# EasyEDA Pro project ProPrj_micropaD_2025-05-19.epro

# Schematic Schematic1
Board Name: Board1; Create Date: 2025-05-16; Page Name: P1; Project Name: micropaD; Schematic Name: Schematic1; Update Date: 2025-05-16; Company: EasyEDA.com; Page Size: A4; Version: V1.0
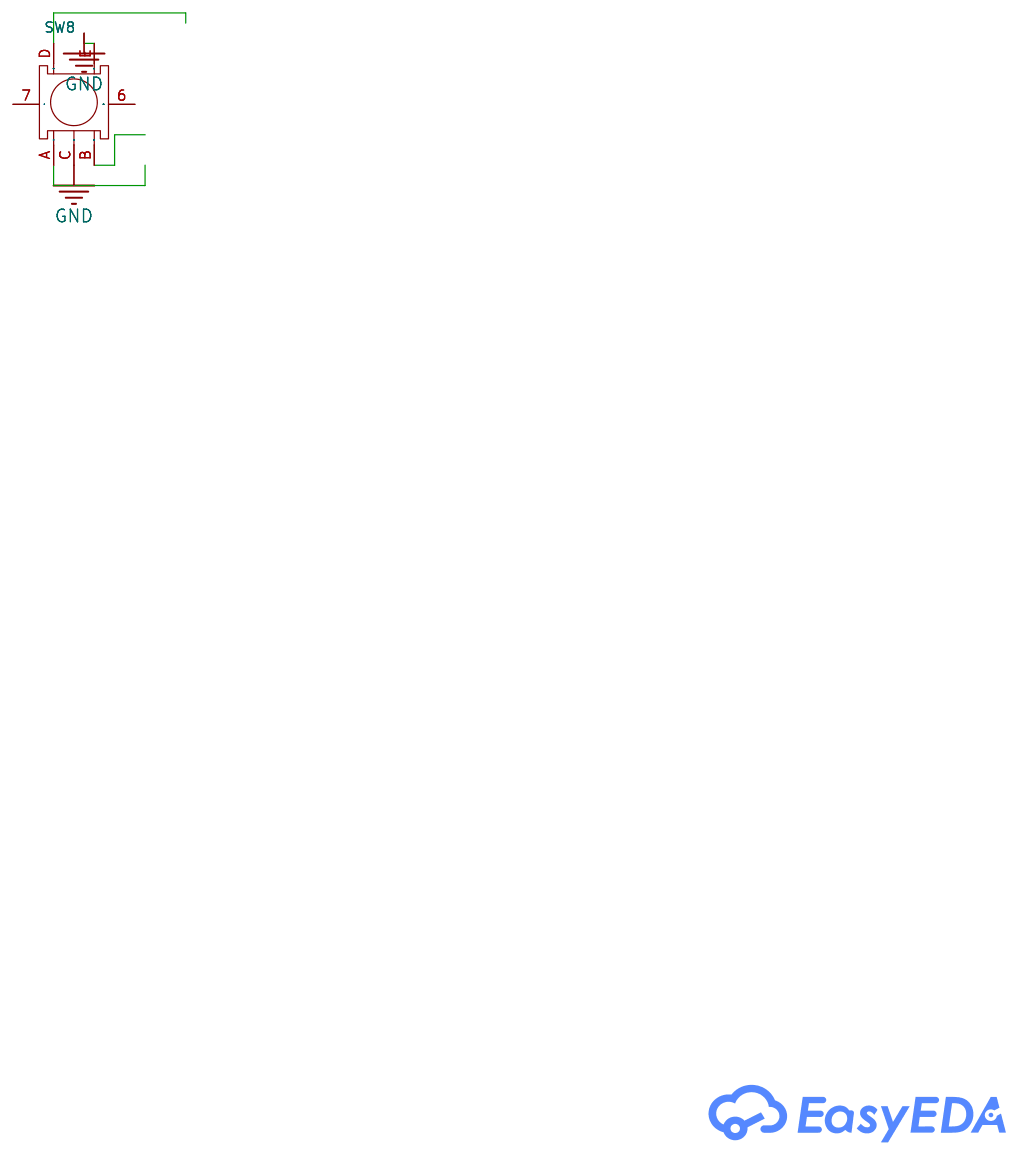
[diagram p0: schematic sheet]

## Parts
SW8  EC11E15244B2  [SW-TH_EC11XXXXXXXX]

## Library data of the parts
SW8 = EC11E15244B2_C470754: Supplier Part: C470754; Manufacturer: ALPSALPINE(阿尔卑斯阿尔派); Supplier Footprint: 插件; JLCPCB Part Class: Extended Part; Datasheet: https://atta.szlcsc.com/upload/public/pdf/source/20191216/C470795_DE763ECE59BD49533DB26DB53E5D34B2.pdf; Supplier: LCSC

## Nets
GND: SW8.C SW8.E

Not connected (* = marked no-connect by the designer): SW8 6 7 A B D

# Board PCB1
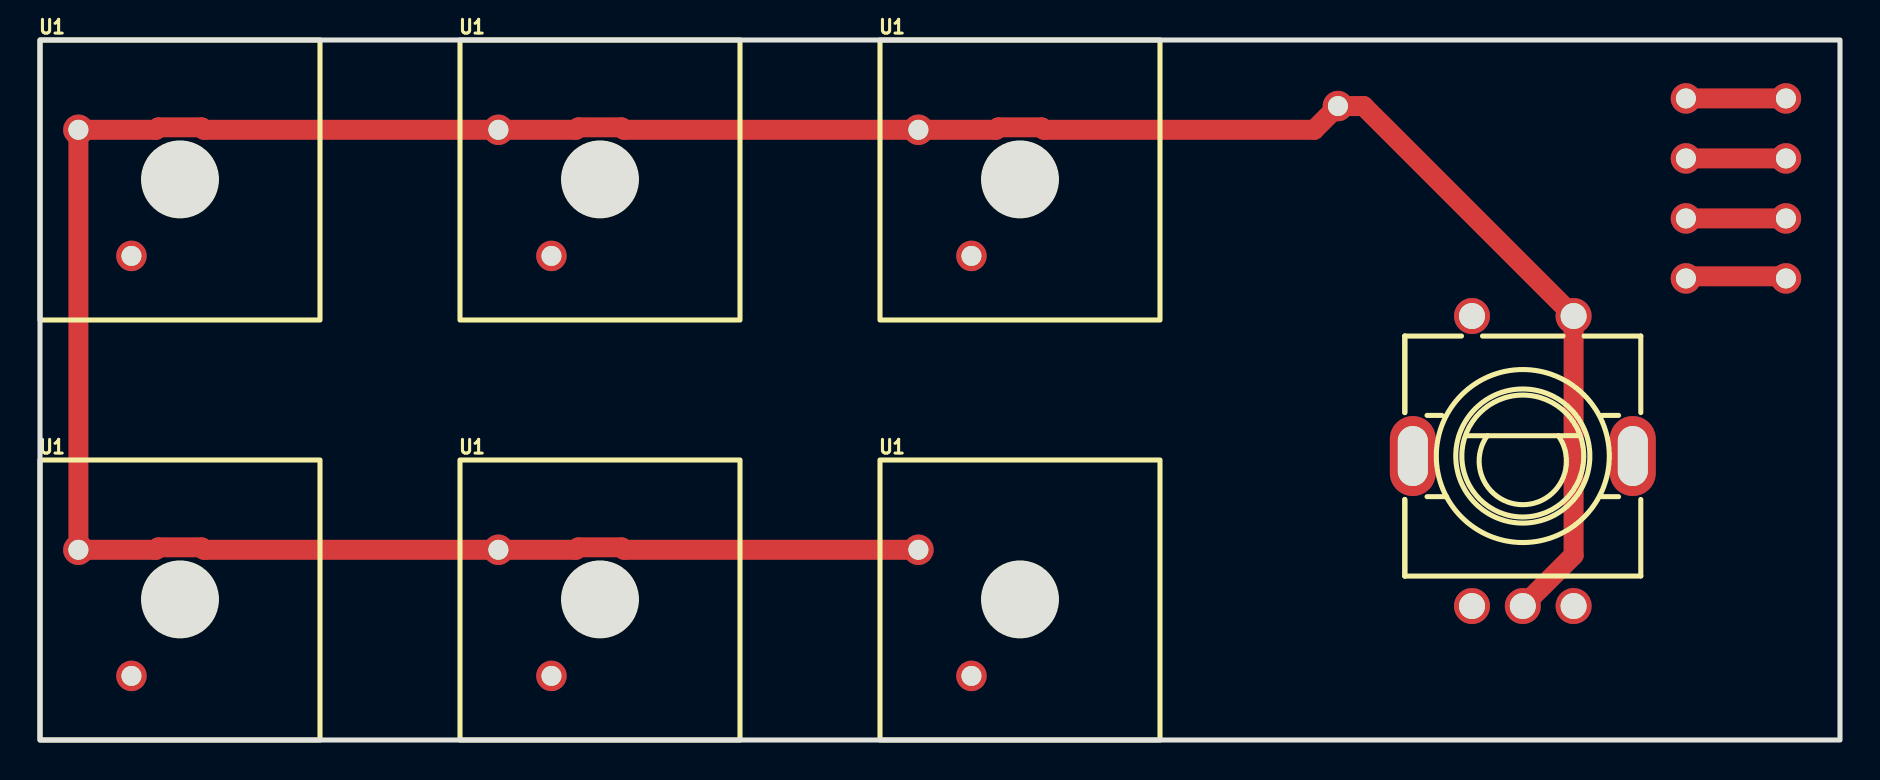
[diagram p1: board, top side]
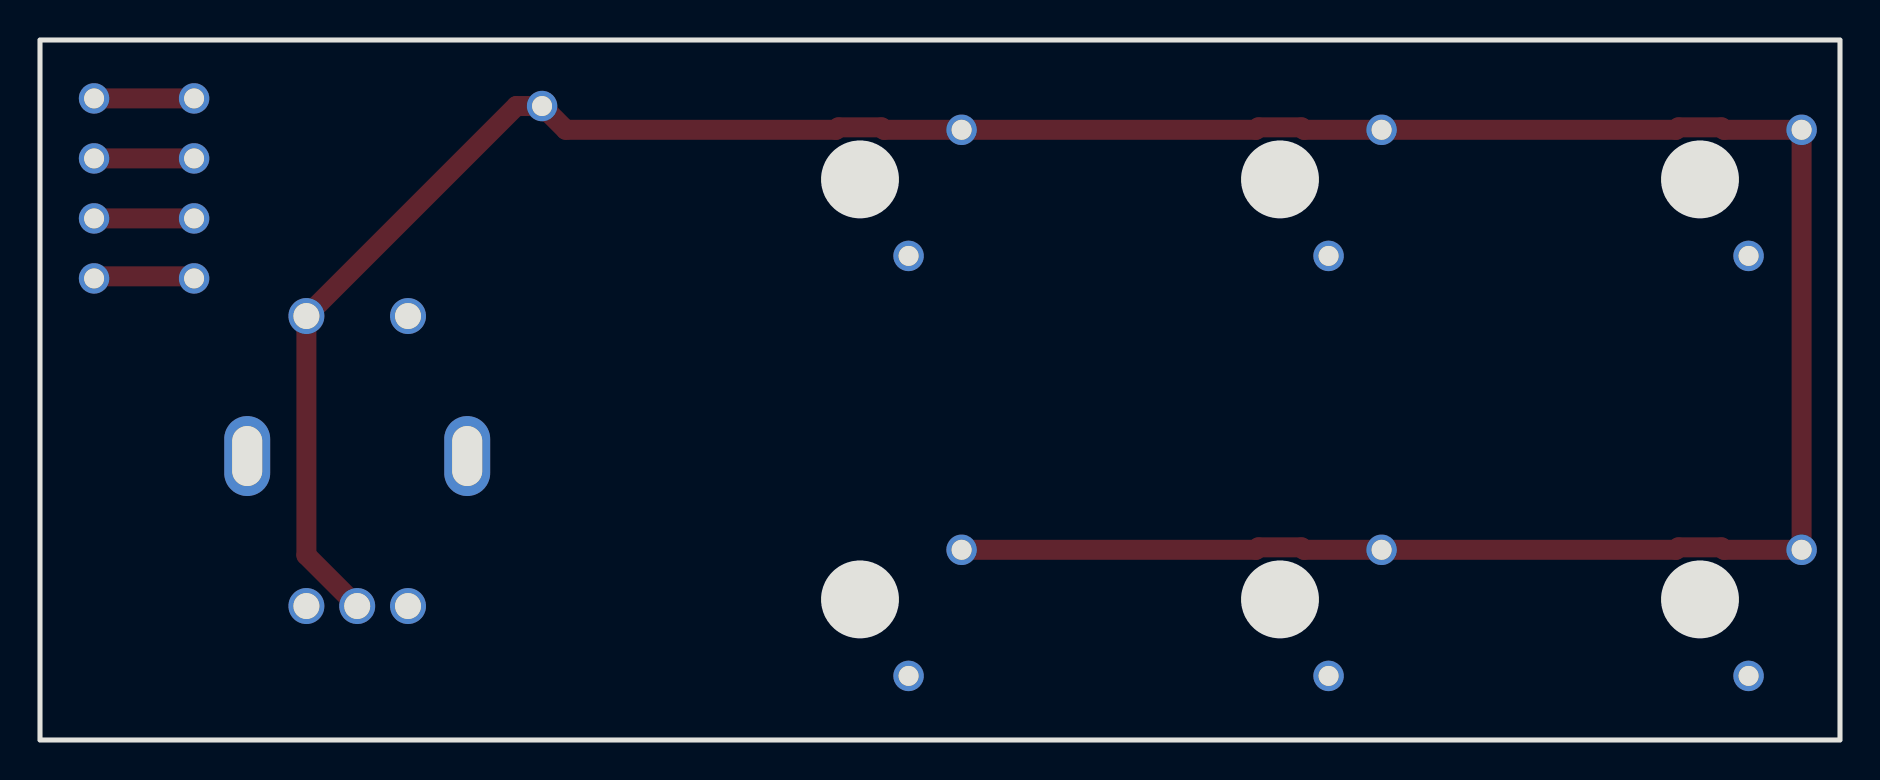
[diagram p2: board, bottom side, seen from below]

Outline 90 x 35 mm; copper layers: Top Layer, Bottom Layer. Coordinates in mm from the lower left corner of the outline.
Outline path: rectangle 0,35 90,0
Stack: Top Layer 0.035mm / Dielectric1 1.51mm FR4 er 4.5 / Bottom Layer 0.035mm

## Design rules (mm)
template: JLCPCB Capability(Two Layers Board)
spacing copperThickness1oz (default): track to track 0.102, other pairs 0.152 to 0.3
spacing copperThickness2oz: track to track 0.203, other pairs 0.152 to 0.3
track width copperThickness1oz (default): min 0.127, default 0.254, max 2.54
track width copperThickness2oz: min 0.203, default 0.254, max 2.54
differential pair differentialPair (default): width min 0.127, default 0.254, max 2.54; gap min 0.152, default 0.152
via viaSize (default): diameter min 0.5, default 0.61, max 10; hole min 0.3, default 0.305, max 6.3

## Placement (name value [footprint] x y rotation side)
NOREF  -  [Pad_e234]  87.3 23.08 0 top
NOREF#2  -  [Pad_e232]  87.3 26.08 0 top
NOREF#3  -  [Pad_e231]  82.3 26.08 0 top
NOREF#4  -  [Pad_e28]  64.9 31.7 0 top
NOREF#5  -  [Pad_e233]  82.3 23.08 0 top
NOREF#6  -  [Pad_e228]  87.3 32.08 0 top
NOREF#7  -  [Pad_e229]  82.3 29.08 0 top
NOREF#8  -  [Pad_e230]  87.3 29.08 0 top
NOREF#9  -  [Pad_e205]  82.3 32.08 0 top
SW8  EC11E15244B2  [SW-TH_EC11XXXXXXXX]  74.14 13.95 0 top
U1  -  [switch]  0 21.03 0 top
U1#2  -  [switch]  21 21.03 0 top
U1#3  -  [switch]  42 21.03 0 top
U1#4  -  [switch]  0 0.03 0 top
U1#5  -  [switch]  21 0.03 0 top
U1#6  -  [switch]  42 0.03 0 top

## Footprints (pads in the part's own frame, mm; a bottom-side part is the same pattern mirrored in y, then rotated)
Pad_e28
  round 1.524 hole 1: 1(0,0)
Pad_e205
  round 1.524 hole 1: 1(0,0)
Pad_e228
  round 1.524 hole 1: 2(0,0)
Pad_e229
  round 1.524 hole 1: 3(0,0)
Pad_e230
  round 1.524 hole 1: 4(0,0)
Pad_e231
  round 1.524 hole 1: 5(0,0)
Pad_e232
  round 1.524 hole 1: 8(0,0)
Pad_e233
  round 1.524 hole 1: 9(0,0)
Pad_e234
  round 1.524 hole 1: 10(0,0)
SW-TH_EC11XXXXXXXX
  oval 2.3x4 hole 1.5x3: 6(5.5,0.25) 7(-5.5,0.25)
  round 1.8 hole 1.3: A(-2.54,-7.25) B(2.54,-7.25) C(0,-7.25) D(-2.54,7.25) E(2.54,7.25)
switch
  round 1.524 hole 1: 1(1.92,9.48) 2(4.572,3.175)

## Nets
GND: NOREF#4.1 SW8.C SW8.E U1.1 U1#2.1 U1#3.1 U1#4.1 U1#5.1 U1#6.1
$1N911: SW8.D
$1N920: SW8.A
$1N926: SW8.B

Pads without a net: NOREF 10; NOREF#2 8; NOREF#3 5; NOREF#5 9; NOREF#6 2; NOREF#7 3; NOREF#8 4; NOREF#9 1; SW8 6 7; U1 2; U1#2 2; U1#3 2; U1#4 2; U1#5 2; U1#6 2

## Via types
v1: diameter 0.61, hole 0.305, Top Layer to Bottom Layer, 2 vias

## Routing (per net, layer and track width the routed paths; a pad name or vN(x,y) marks a point on that pad's centre or on a via; arc(x,y) is an arc through that point)
GND: length 158.7
  Top Layer w1: SW8.C 76.68,9.24 SW8.E 66.18,31.7 NOREF#4.1 63.71,30.51 50.2,30.51 50.08,30.63 47.92,30.63 47.8,30.51 U1#3.1 29.2,30.51 29.08,30.63 26.92,30.63 26.8,30.51 U1#2.1 8.2,30.51 8.08,30.63 5.92,30.63 5.8,30.51 U1.1 U1#4.1 5.8,9.51 5.92,9.63 8.08,9.63 8.2,9.51 U1#5.1 26.8,9.51 26.92,9.63 29.08,9.63 29.2,9.51 U1#6.1
(no net): length 20.1
  Top Layer w0.254: v1(87.19,23.18) NOREF.10 ; NOREF#5.9 v1(82.4,23.18)
  Top Layer w1: NOREF#3.5 NOREF#2.8 ; NOREF#7.3 NOREF#8.4 ; v1(82.4,23.18) v1(87.19,23.18) ; NOREF#9.1 NOREF#6.2
